# Altium schematic sheet Load2.SchDoc
size A4; SheetNumber: 5; SheetTotal: 15
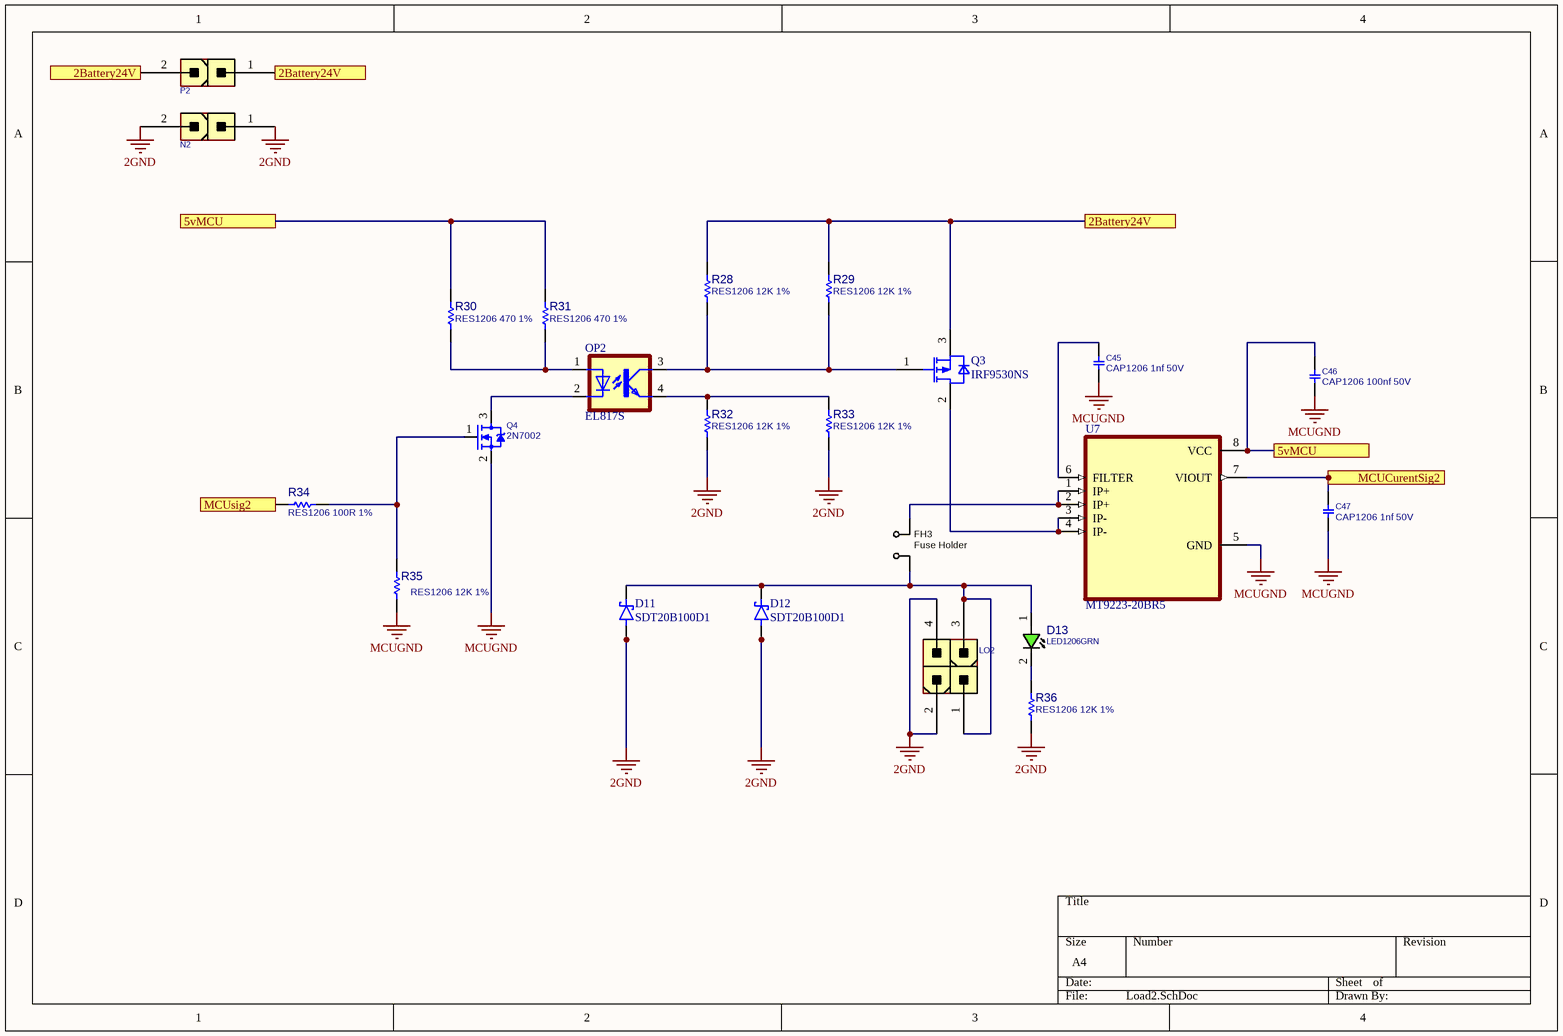
[diagram p0: Load2.SchDoc]

## Parts
C45  CAP1206 1nf 50V  [C1206]
C46  CAP1206 100nf 50V  [C1206]
C47  CAP1206 1nf 50V  [C1206]
D11  SDT20B100D1  [DPAK229P990X238-3N]
D12  SDT20B100D1  [DPAK229P990X238-3N]
D13  LED1206GRN  [LED1206GRN]
FH3  Fuse Holder  [FH_24101812]
LO2  CONN_ATXPWR_4  [ATXPWR_4]  (value not drawn)
N2  CONN_ATXPWR_2  [ATXPWR_2]  (value not drawn)
OP2  EL817S  [SOIC254P1030X460-4N]
P2  CONN_ATXPWR_2  [ATXPWR_2]  (value not drawn)
Q3  IRF9530NS  [TO254P1528X508-4_3N-V1]
Q4  2N7002  [SOT23_3]
R28  RES1206 12K 1%  [R1206]
R29  RES1206 12K 1%  [R1206]
R30  RES1206 470 1%  [R1206]
R31  RES1206 470 1%  [R1206]
R32  RES1206 12K 1%  [R1206]
R33  RES1206 12K 1%  [R1206]
R34  RES1206 100R 1%  [R1206]
R35  RES1206 12K 1%  [R1206]
R36  RES1206 12K 1%  [R1206]
U7  MT9223-20BR5  [SOIC127P600X175-8N]

## Ports
2Battery24V, 5vMCU, MCUCurentSig2, MCUsig2

## Nets
2GND: D11.1(A) D11.3(A__1) D12.1(A) D12.3(A__1) LO2.2 LO2.4 N2.1 N2.2 R32.2 R33.2 R36.2
MCUGND: C45.2 C46.2 C47.2 Q4.2(SOURCE) R35.2 U7.5(GND)
2Battery24V: P2.1 P2.2 Q3.3(SOURCE) R28.1 R29.1 ; port 2Battery24V
5vMCU: C46.1 R30.2 R31.2 U7.8(VCC) ; port 5vMCU
MCUCurentSig2: C47.1 U7.7(VIOUT) ; port MCUCurentSig2
MCUsig2: R34.1 ; port MCUsig2
NetC45_1: C45.1 U7.6(FILTER)
NetD11_4: D11.4(K) D12.4(K) D13.1(ANODE) FH3.1 LO2.1 LO2.3
NetD13_2: D13.2(CATHODE) R36.1
NetFH3_2: FH3.2 U7.1(IP+) U7.2(IP+)
NetOP2_1: OP2.1(A) R30.1 R31.1
NetOP2_2: OP2.2(C) Q4.3(DRAIN)
NetOP2_3: OP2.3(COL) Q3.1(GATE) R28.2 R29.2
NetOP2_4: OP2.4(EMIT) R32.1 R33.1
NetQ3_2: Q3.2(DRAIN) U7.3(IP-) U7.4(IP-)
NetQ4_1: Q4.1(GATE) R34.2 R35.1

## Library data of the parts
C45-C47 = CAP_SMD_MLCC_1206: CAP, MLCC; PARAM: -, -%; MANF_P#: MANF_PART#; PARAM2: -V; PRICE: 100= 1$; MANF: -; ASSEMBLY: ASSEMBLY
D11 D12 = MBRD835L: Diode Schottky 35 V 8A Surface Mount DPAK; MF: ON Semiconductor; SnapEDA_Link: https://www.snapeda.com/parts/MBRD835L/Onsemi/view-part/?ref=snap; Package: TO-252-3 MICROSS/On Semiconductor; Value: *; MP: MBRD835L; Check_prices: https://www.snapeda.com/parts/MBRD835L/Onsemi/view-part/?ref=eda
D13 = LED_SMD_1206_GRN: LED, SMD, 1206, GREEN; PARAM: 20mA; DESC: DESCRIPTION; PARAM2: 2.2V; MANF: -; ASSEMBLY: ASSEMBLY; PRICE: 36t@Javan; MANF_P#: -; VALUE: LED1206GRN; MountType: SMT; PartType: LED
FH3 = FUSE_SMD_HOLDER_24101812: Fuse SMD2410 Holder; PARAM: max. 10A; MANF: Littelfuse; MANF_P#: 01550900M; PARAM2: 125v; PRICE: 0.2$; PACKAGE: SMD,5.0x9.7mm; VALUE: Fuse Holder
LO2 = CONN_ATXPWR_4: CONN, ATX POWER, 4 P; MANF: TE, Molex; MANF_P#: 4-1775099-0, 39281043; VALUE: CONN_ATXPWR_4; MountType: THD; PACKAGE: ATXPWR-4pin; Part Type: Conn.
N2 P2 = CONN_ATXPWR_2: CONN, ATX POWER, 2 P; MANF: Molex; MANF_P#: 39281023; VALUE: CONN_ATXPWR_2; MountType: THD; PACKAGE: ATXPWR-2pin; Part Type: Conn.
OP2 = EL817S: Optoisolator Transistor Output 5000Vrms 1 Channel 4-SMD; MF: Everlight Electronics; SnapEDA_Link: https://www.snapeda.com/parts/EL817S/Everlight+Electronics+Co+Ltd/view-part/?ref=snap; Package: SMD-4 Everlight Electronics Co Ltd; Value: *; MP: EL817S; Check_prices: https://www.snapeda.com/parts/EL817S/Everlight+Electronics+Co+Ltd/view-part/?ref=eda
Q3 = IRF9530NS: OptiMOS - P2 Power-Transistor, P-channel-Enhancement mode, VDS -30V; Manufacturer: Infineon Technologies; Manufacturer Order NumberManufacturer Order Number: IRF9530NS; PackageReference: PG-TO263-3-901
Q4 = MOSN_2N7002_SOT23: MOSFET, N-CH, 60V, 0.3A; MANF: NXP; ASSEMBLY: ASSEMBLY; MANF_P#: 2N7002; PARAM2: 60v; PARAM: 0.3A; PRICE: 0.3t@Javan; VALUE: 2N7002
R28-R36 = RES_SMD_1206: RESISTOR, SMD; PARAM: 1%, 0.25W; DESC: DESCRIPTION; DIST#: MOUSER; MANF_P#: -; MANF: -; ASSEMBLY: ASSEMBLY; PRICE: -; PARAM2: -
U7 = ACS712ELCTR-05B-T: MF: {'manufacturer': u'Allegro MicroSystems'}; Package: None; Price: None; Value: *; MP: ACS712ELCTR-05B-T; Availability: Unavailable